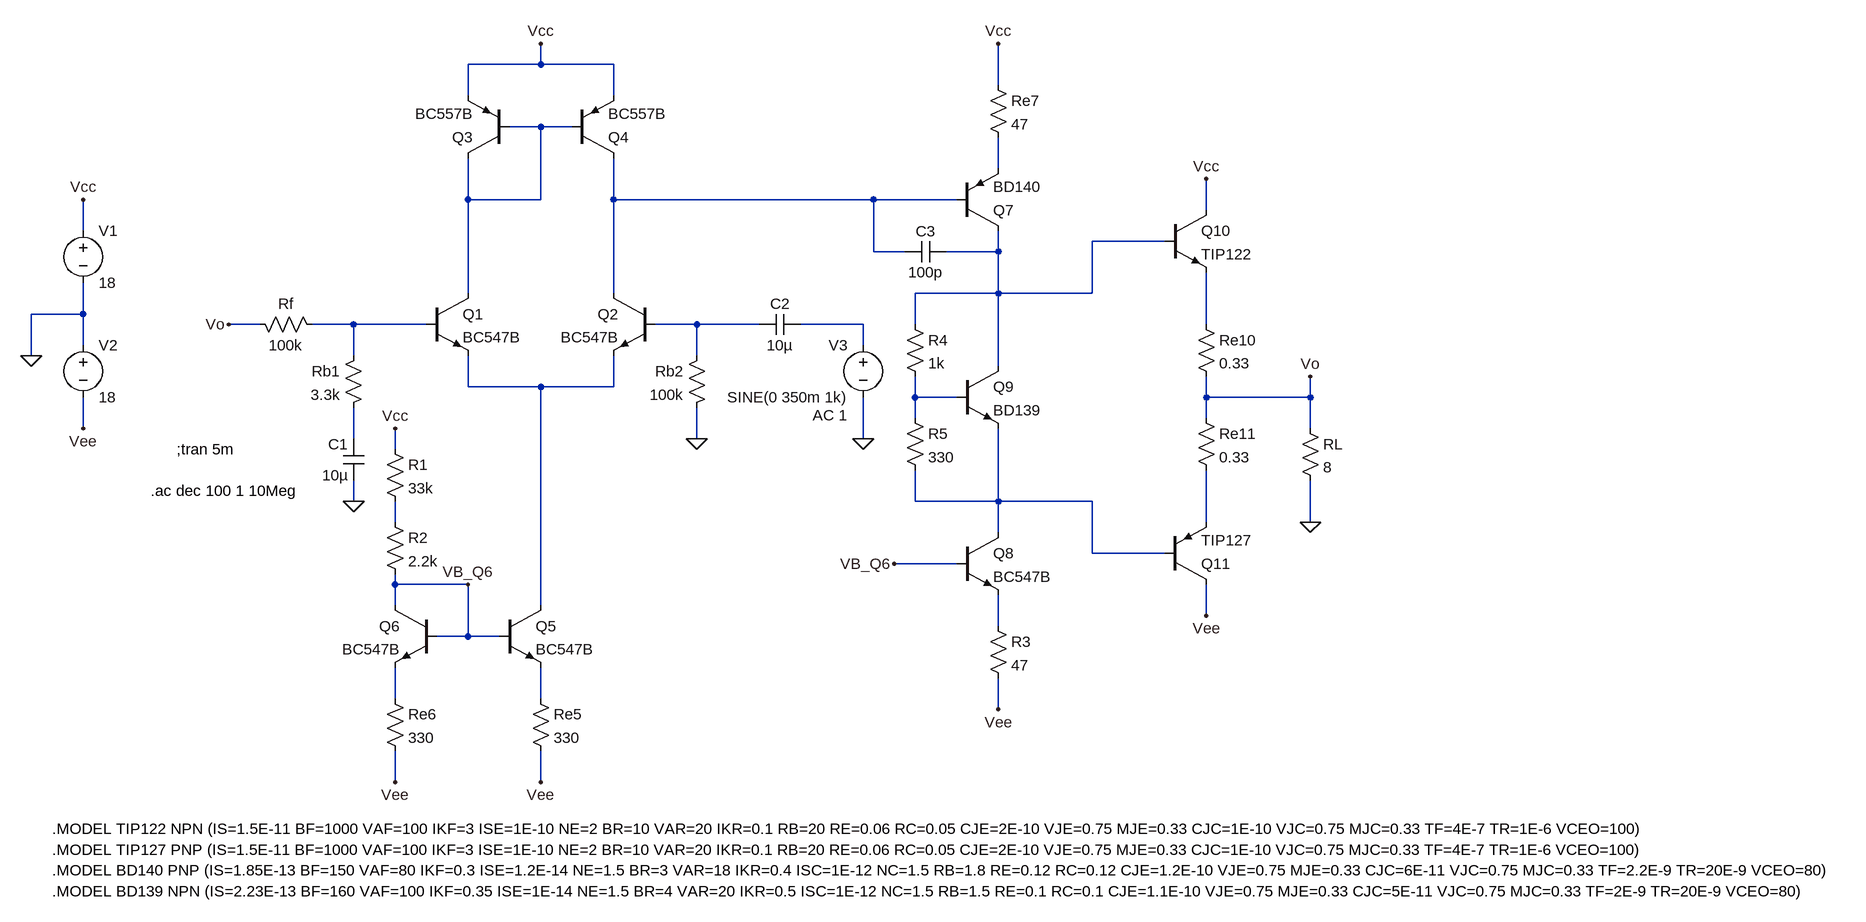
[diagram p0: schematic Amplificador.asc]
Amplificador.asc, the LTspice schematic file:
Version 4.1
SHEET 1 2480 1136
WIRE 144 -224 144 -256
WIRE 144 -224 32 -224
WIRE 256 -224 144 -224
WIRE 848 -192 848 -256
WIRE 32 -176 32 -224
WIRE 256 -176 256 -224
WIRE 144 -128 96 -128
WIRE 192 -128 144 -128
WIRE 848 -64 848 -112
WIRE 32 -16 32 -80
WIRE 144 -16 144 -128
WIRE 144 -16 32 -16
WIRE 256 -16 256 -80
WIRE 656 -16 256 -16
WIRE 784 -16 656 -16
WIRE 1168 0 1168 -48
WIRE -560 32 -560 -16
WIRE 1104 48 992 48
WIRE 656 64 656 -16
WIRE 704 64 656 64
WIRE 848 64 848 32
WIRE 848 64 768 64
WIRE 32 128 32 -16
WIRE 256 128 256 -16
WIRE 848 128 848 64
WIRE 848 128 720 128
WIRE 992 128 992 48
WIRE 992 128 848 128
WIRE -560 160 -560 112
WIRE -560 160 -640 160
WIRE -288 176 -336 176
WIRE -144 176 -208 176
WIRE -32 176 -144 176
WIRE 384 176 320 176
WIRE 480 176 384 176
WIRE 640 176 544 176
WIRE 720 176 720 128
WIRE 1168 176 1168 96
WIRE -560 208 -560 160
WIRE 640 208 640 176
WIRE -640 224 -640 160
WIRE -144 224 -144 176
WIRE 384 224 384 176
WIRE 848 240 848 128
WIRE 32 272 32 224
WIRE 144 272 32 272
WIRE 256 272 256 224
WIRE 256 272 144 272
WIRE 720 288 720 256
WIRE 784 288 720 288
WIRE 1168 288 1168 256
WIRE 1328 288 1328 256
WIRE 1328 288 1168 288
WIRE 720 320 720 288
WIRE 1168 320 1168 288
WIRE -560 336 -560 288
WIRE 1328 336 1328 288
WIRE -144 352 -144 304
WIRE 384 352 384 304
WIRE 640 352 640 288
WIRE -80 368 -80 336
WIRE -144 448 -144 416
WIRE 720 448 720 400
WIRE 848 448 848 336
WIRE 848 448 720 448
WIRE 992 448 848 448
WIRE -80 480 -80 448
WIRE 1168 480 1168 400
WIRE 1328 480 1328 416
WIRE 848 496 848 448
WIRE 992 528 992 448
WIRE 1104 528 992 528
WIRE 784 544 688 544
WIRE -80 576 -80 560
WIRE 32 576 -80 576
WIRE -80 608 -80 576
WIRE 144 608 144 272
WIRE 1168 624 1168 576
WIRE 848 640 848 592
WIRE 32 656 32 576
WIRE 32 656 -16 656
WIRE 80 656 32 656
WIRE -80 752 -80 704
WIRE 144 752 144 704
WIRE 848 768 848 720
WIRE -80 880 -80 832
WIRE 144 880 144 832
FLAG 384 352 0
FLAG -640 224 0
FLAG -560 336 Vee
FLAG -80 880 Vee
FLAG 144 880 Vee
FLAG 640 352 0
FLAG -560 -16 Vcc
FLAG 144 -256 Vcc
FLAG -80 336 Vcc
FLAG 848 -256 Vcc
FLAG 848 768 Vee
FLAG 1168 -48 Vcc
FLAG 1168 624 Vee
FLAG 1328 480 0
FLAG 1328 256 Vo
FLAG -336 176 Vo
FLAG 32 576 VB_Q6
FLAG 688 544 VB_Q6
FLAG -144 448 0
DATAFLAG 1168 608 ""
DATAFLAG 896 448 ""
DATAFLAG 896 128 ""
DATAFLAG 384 -16 ""
DATAFLAG -112 176 ""
DATAFLAG 384 176 ""
DATAFLAG 1168 -16 ""
DATAFLAG 1248 288 ""
SYMBOL npn -32 128 R0
SYMATTR InstName Q1
SYMATTR Value BC547B
SYMBOL npn 320 128 M0
SYMATTR InstName Q2
SYMATTR Value BC547B
SYMBOL pnp 96 -80 R180
SYMATTR InstName Q3
SYMATTR Value BC557B
SYMBOL pnp 192 -80 M180
SYMATTR InstName Q4
SYMATTR Value BC557B
SYMBOL npn 80 608 R0
SYMATTR InstName Q5
SYMATTR Value BC547B
SYMBOL npn -16 608 M0
SYMATTR InstName Q6
SYMATTR Value BC547B
SYMBOL res -96 352 R0
SYMATTR InstName R1
SYMATTR Value 33k
SYMBOL res -96 736 R0
SYMATTR InstName Re6
SYMATTR Value 330
SYMBOL res 128 736 R0
SYMATTR InstName Re5
SYMATTR Value 330
SYMBOL res 400 208 M0
SYMATTR InstName Rb2
SYMATTR Value 100k
SYMBOL voltage -560 16 R0
SYMATTR InstName V1
SYMATTR Value 18
SYMBOL voltage -560 192 R0
SYMATTR InstName V2
SYMATTR Value 18
SYMBOL cap 480 160 M90
WINDOW 0 0 32 VBottom 2
WINDOW 3 32 32 VTop 2
SYMATTR InstName C2
SYMATTR Value 10µ
SYMBOL voltage 640 192 M0
WINDOW 123 24 124 Left 2
WINDOW 39 0 0 Left 0
SYMATTR Value2 AC 1
SYMATTR InstName V3
SYMATTR Value SINE(0 350m 1k)
SYMBOL res -96 464 R0
SYMATTR InstName R2
SYMATTR Value 2.2k
SYMBOL res -128 208 M0
SYMATTR InstName Rb1
SYMATTR Value 3.3k
SYMBOL res -304 160 M90
WINDOW 0 0 56 VBottom 2
WINDOW 3 32 56 VTop 2
SYMATTR InstName Rf
SYMATTR Value 100k
SYMBOL cap 768 48 R90
WINDOW 0 0 32 VBottom 2
WINDOW 3 32 32 VTop 2
SYMATTR InstName C3
SYMATTR Value 100p
SYMBOL res 832 -208 R0
SYMATTR InstName Re7
SYMATTR Value 47
SYMBOL npn 784 496 R0
SYMATTR InstName Q8
SYMATTR Value BC547B
SYMBOL res 832 624 R0
SYMATTR InstName R3
SYMATTR Value 47
SYMBOL npn 784 240 R0
SYMATTR InstName Q9
SYMATTR Value BD139
SYMBOL res 704 160 R0
SYMATTR InstName R4
SYMATTR Value 1k
SYMBOL res 704 304 R0
SYMATTR InstName R5
SYMATTR Value 330
SYMBOL npn 1104 0 R0
SYMATTR InstName Q10
SYMATTR Value TIP122
SYMBOL pnp 1104 576 M180
SYMATTR InstName Q11
SYMATTR Value TIP127
SYMBOL res 1312 320 R0
SYMATTR InstName RL
SYMATTR Value 8
SYMBOL pnp 784 32 M180
SYMATTR InstName Q7
SYMATTR Value BD140
SYMBOL res 1152 304 R0
SYMATTR InstName Re11
SYMATTR Value 0.33
SYMBOL res 1152 160 R0
SYMATTR InstName Re10
SYMATTR Value 0.33
SYMBOL cap -128 352 M0
SYMATTR InstName C1
SYMATTR Value 10µ
TEXT -608 952 Left 2 !.MODEL TIP122 NPN (IS=1.5E-11 BF=1000 VAF=100 IKF=3 ISE=1E-10 NE=2 BR=10 VAR=20 IKR=0.1 RB=20 RE=0.06 RC=0.05 CJE=2E-10 VJE=0.75 MJE=0.33 CJC=1E-10 VJC=0.75 MJC=0.33 TF=4E-7 TR=1E-6 VCEO=100)
TEXT -608 984 Left 2 !.MODEL TIP127 PNP (IS=1.5E-11 BF=1000 VAF=100 IKF=3 ISE=1E-10 NE=2 BR=10 VAR=20 IKR=0.1 RB=20 RE=0.06 RC=0.05 CJE=2E-10 VJE=0.75 MJE=0.33 CJC=1E-10 VJC=0.75 MJC=0.33 TF=4E-7 TR=1E-6 VCEO=100)
TEXT -608 1016 Left 2 !.MODEL BD140 PNP (IS=1.85E-13 BF=150 VAF=80 IKF=0.3 ISE=1.2E-14 NE=1.5 BR=3 VAR=18 IKR=0.4 ISC=1E-12 NC=1.5 RB=1.8 RE=0.12 RC=0.12 CJE=1.2E-10 VJE=0.75 MJE=0.33 CJC=6E-11 VJC=0.75 MJC=0.33 TF=2.2E-9 TR=20E-9 VCEO=80)
TEXT -416 368 Left 2 !;tran 5m
TEXT -456 432 Left 2 !.ac dec 100 1 10Meg
TEXT -608 1048 Left 2 !.MODEL BD139 NPN (IS=2.23E-13 BF=160 VAF=100 IKF=0.35 ISE=1E-14 NE=1.5 BR=4 VAR=20 IKR=0.5 ISC=1E-12 NC=1.5 RB=1.5 RE=0.1 RC=0.1 CJE=1.1E-10 VJE=0.75 MJE=0.33 CJC=5E-11 VJC=0.75 MJC=0.33 TF=2E-9 TR=20E-9 VCEO=80)

The netlist it stands for:
* Amplificador.asc
Q1 N001 N005 N009 0 BC547B
Q2 N003 N006 N009 0 BC547B
Q3 N001 N001 Vcc 0 BC557B
Q4 N003 N001 Vcc 0 BC557B
Q5 N009 VB_Q6 N017 0 BC547B
Q6 VB_Q6 VB_Q6 N016 0 BC547B
R1 Vcc N013 33k
Re6 N016 Vee 330
Re5 N017 Vee 330
Rb2 N006 0 100k
V1 Vcc 0 18
V2 0 Vee 18
C2 N006 N007 10µ
V3 N007 0 SINE(0 350m 1k) AC 1
R2 N013 VB_Q6 2.2k
Rb1 N005 N011 3.3k
Rf Vo N005 100k
C3 N004 N003 100p
Re7 Vcc N002 47
Q8 N012 VB_Q6 N015 0 BC547B
R3 N015 Vee 47
Q9 N004 N010 N012 0 BD139
R4 N004 N010 1k
R5 N010 N012 330
Q10 Vcc N004 N008 0 TIP122
Q11 Vee N012 N014 0 TIP127
RL Vo 0 8
Q7 N004 N003 N002 0 BD140
Re11 Vo N014 0.33
Re10 N008 Vo 0.33
C1 N011 0 10µ
.model NPN NPN
.model PNP PNP
.lib standard.bjt
.MODEL TIP122 NPN (IS=1.5E-11 BF=1000 VAF=100 IKF=3 ISE=1E-10 NE=2 BR=10 VAR=20 IKR=0.1 RB=20 RE=0.06 RC=0.05 CJE=2E-10 VJE=0.75 MJE=0.33 CJC=1E-10 VJC=0.75 MJC=0.33 TF=4E-7 TR=1E-6 VCEO=100)
.MODEL TIP127 PNP (IS=1.5E-11 BF=1000 VAF=100 IKF=3 ISE=1E-10 NE=2 BR=10 VAR=20 IKR=0.1 RB=20 RE=0.06 RC=0.05 CJE=2E-10 VJE=0.75 MJE=0.33 CJC=1E-10 VJC=0.75 MJC=0.33 TF=4E-7 TR=1E-6 VCEO=100)
.MODEL BD140 PNP (IS=1.85E-13 BF=150 VAF=80 IKF=0.3 ISE=1.2E-14 NE=1.5 BR=3 VAR=18 IKR=0.4 ISC=1E-12 NC=1.5 RB=1.8 RE=0.12 RC=0.12 CJE=1.2E-10 VJE=0.75 MJE=0.33 CJC=6E-11 VJC=0.75 MJC=0.33 TF=2.2E-9 TR=20E-9 VCEO=80)
;tran 5m
.ac dec 100 1 10Meg
.MODEL BD139 NPN (IS=2.23E-13 BF=160 VAF=100 IKF=0.35 ISE=1E-14 NE=1.5 BR=4 VAR=20 IKR=0.5 ISC=1E-12 NC=1.5 RB=1.5 RE=0.1 RC=0.1 CJE=1.1E-10 VJE=0.75 MJE=0.33 CJC=5E-11 VJC=0.75 MJC=0.33 TF=2E-9 TR=20E-9 VCEO=80)
.backanno
.end